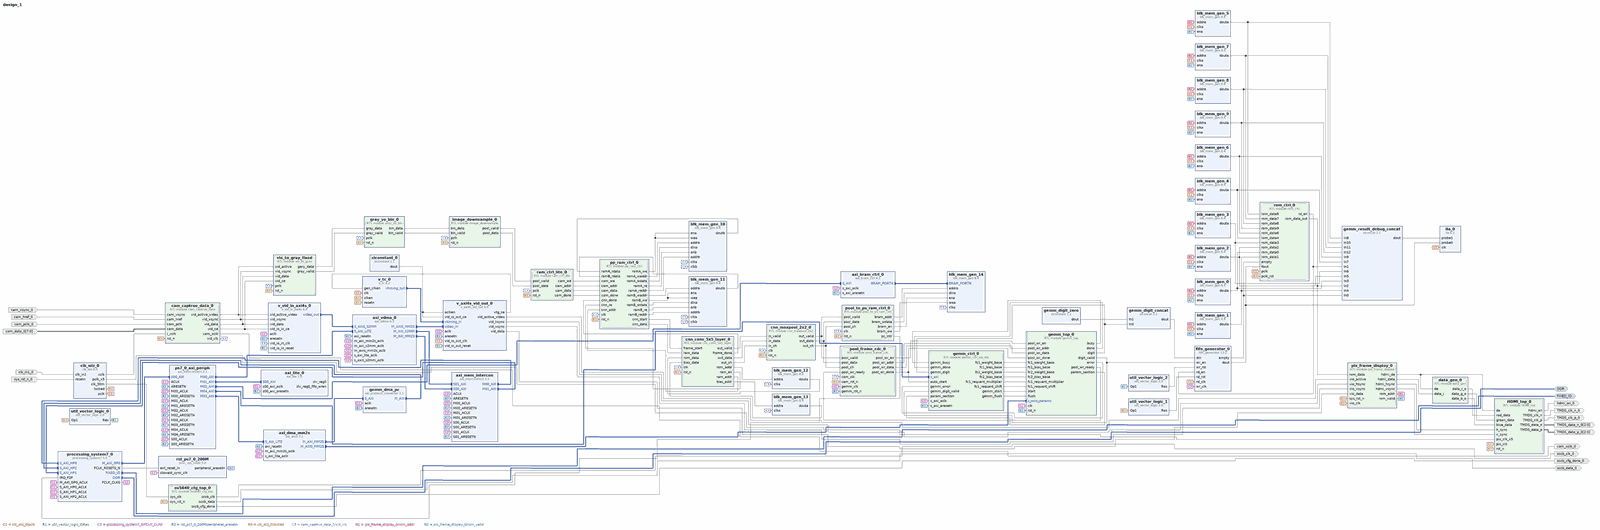
[diagram p0: block diagram of the top level, whole]
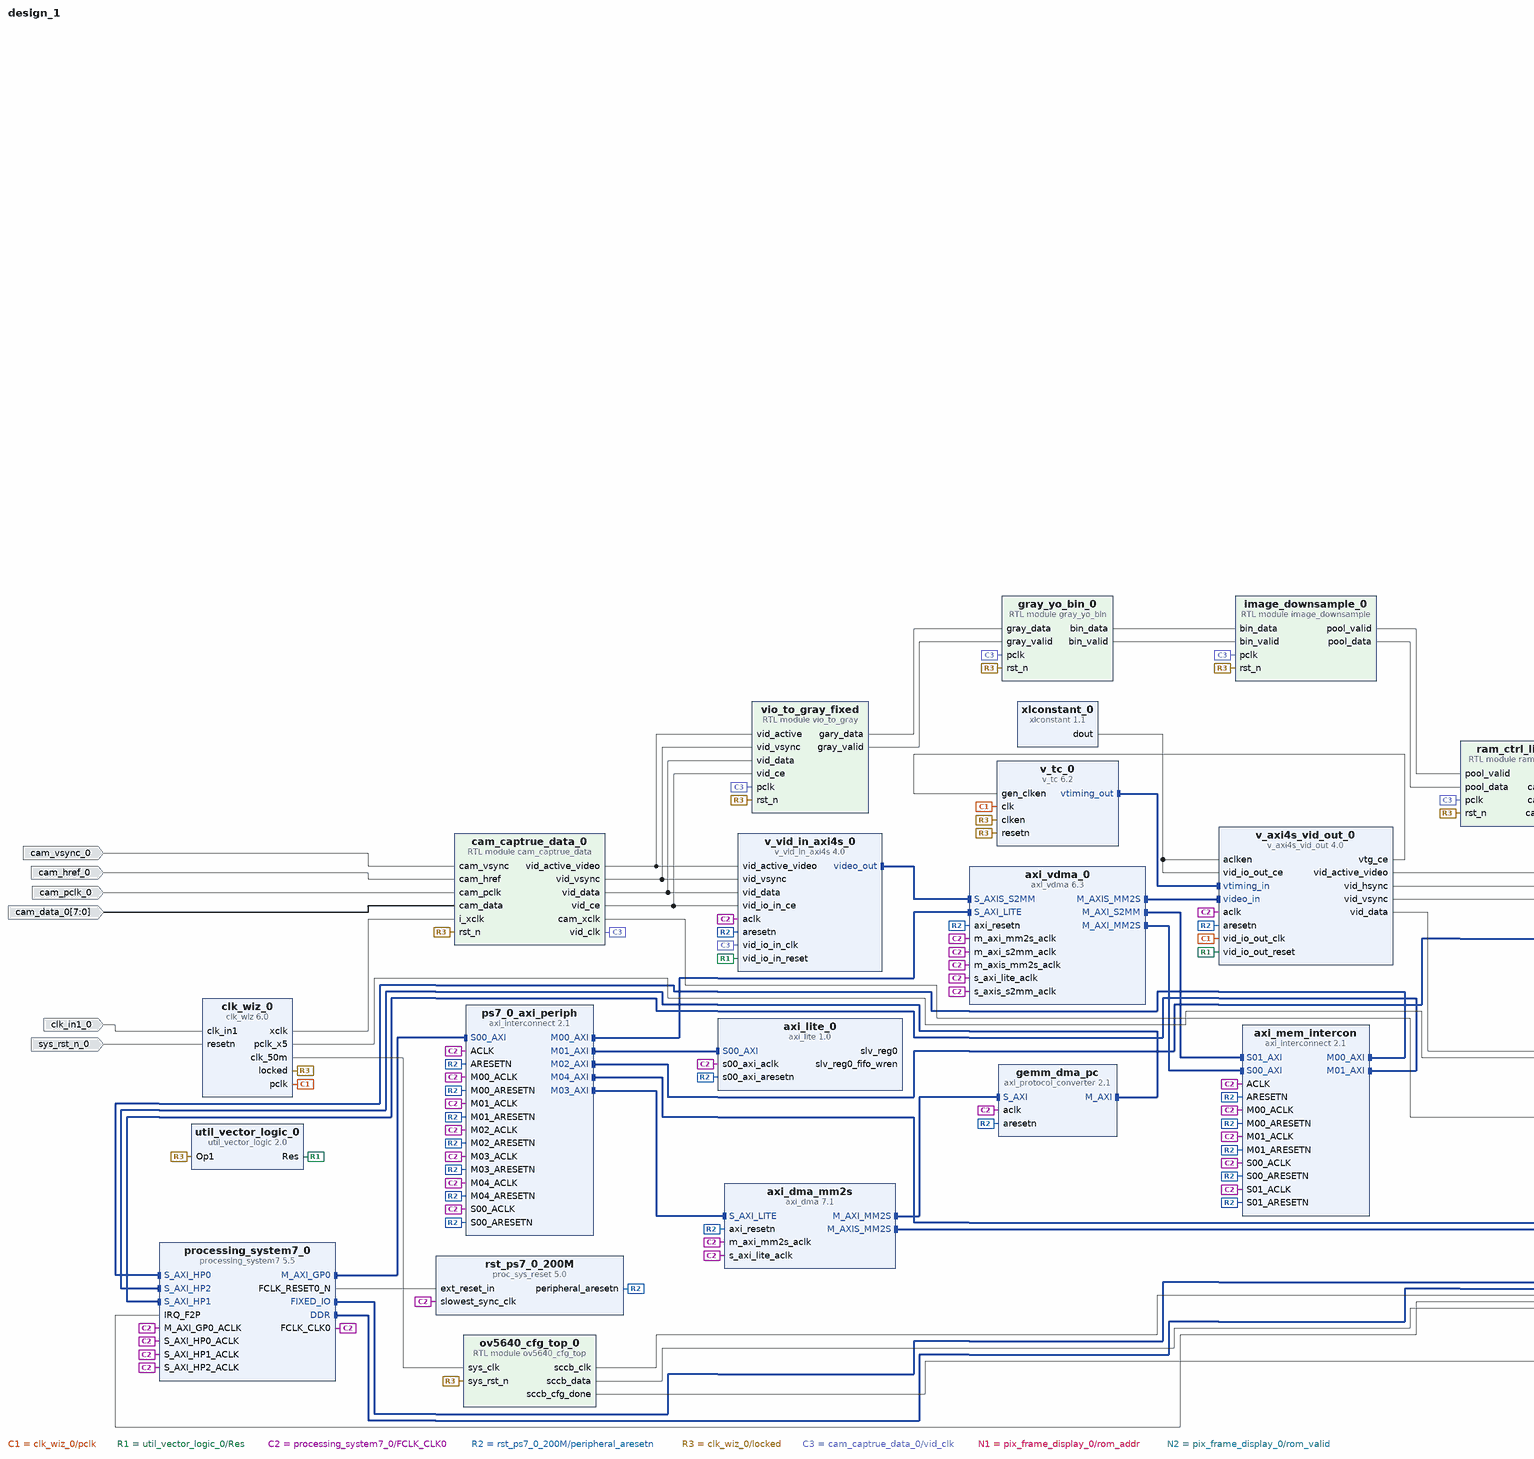
[diagram p1: block diagram of the top level, left part]
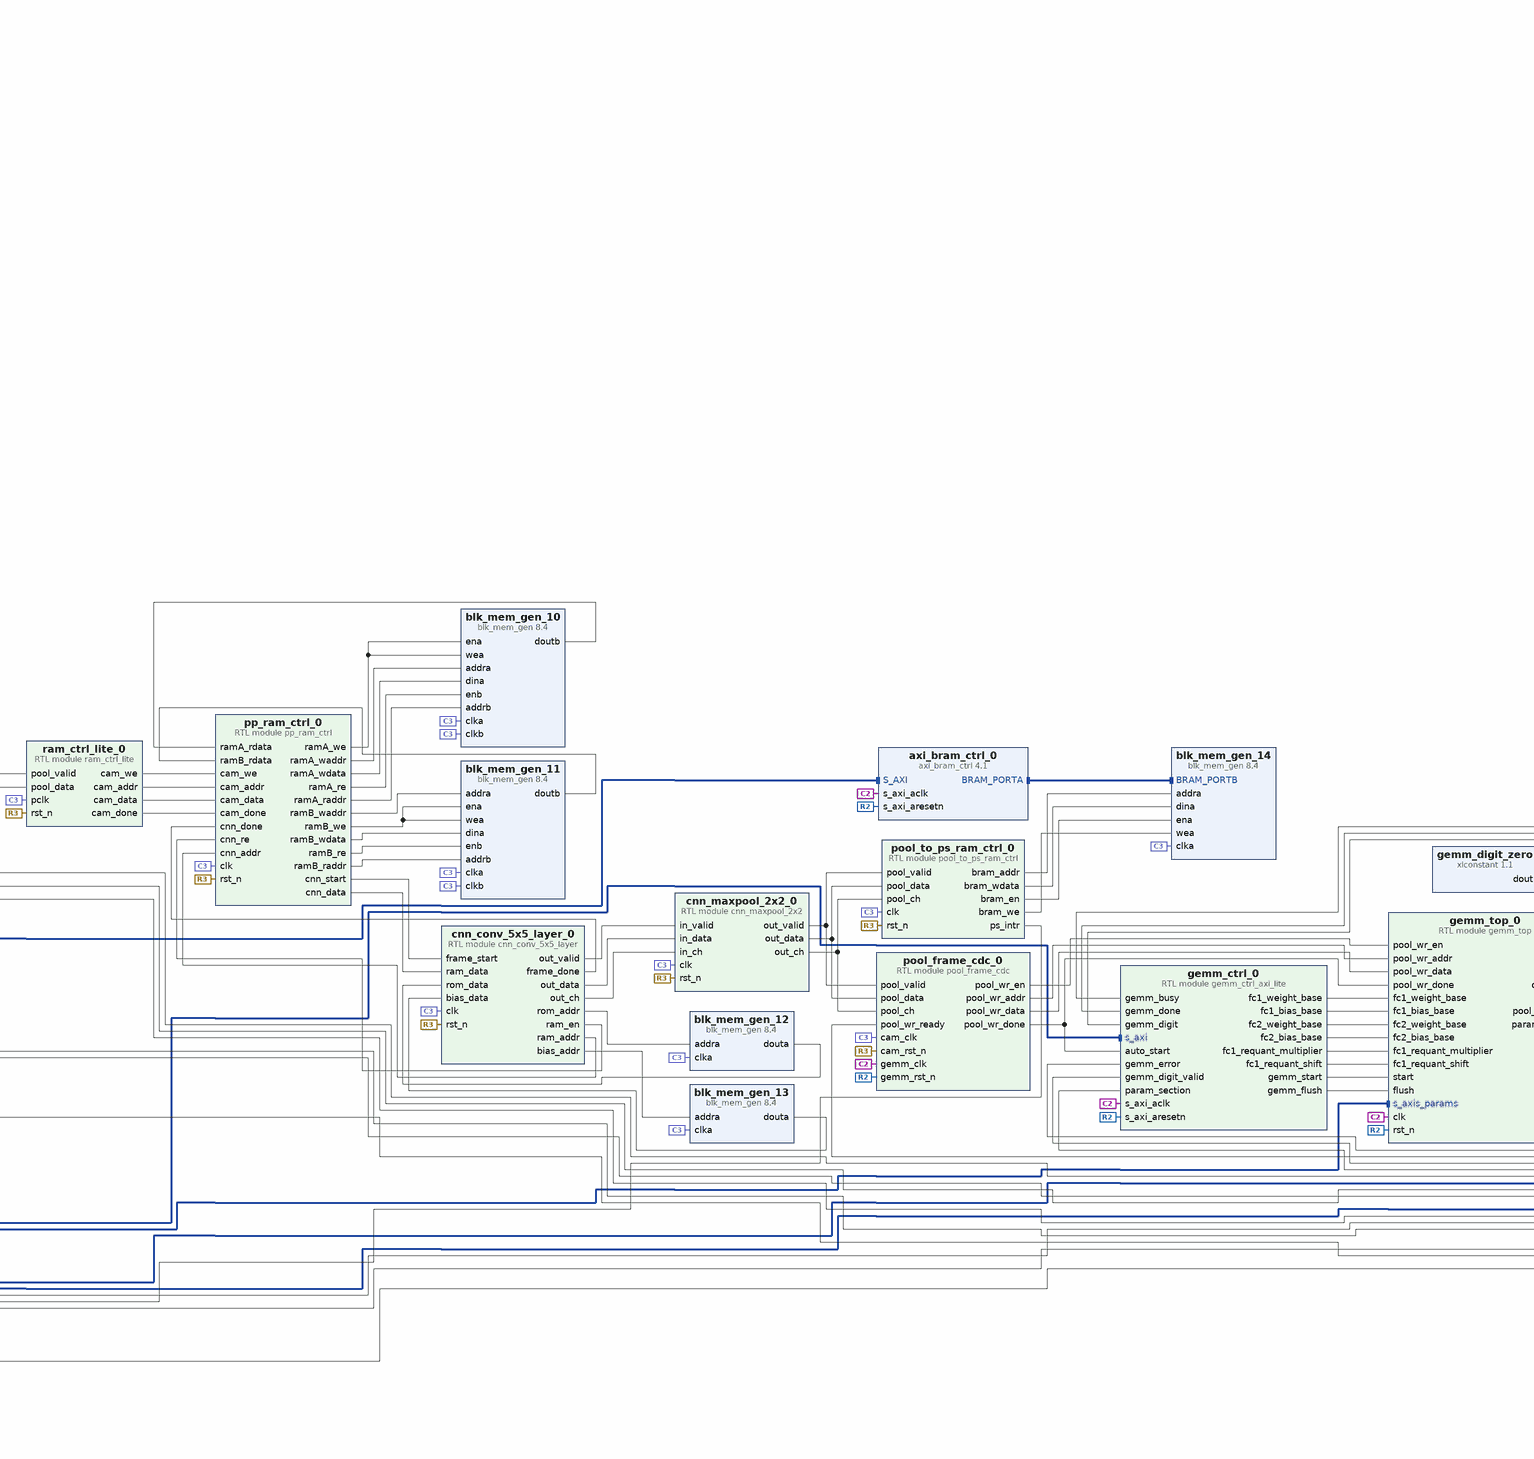
[diagram p2: block diagram of the top level, centre part]
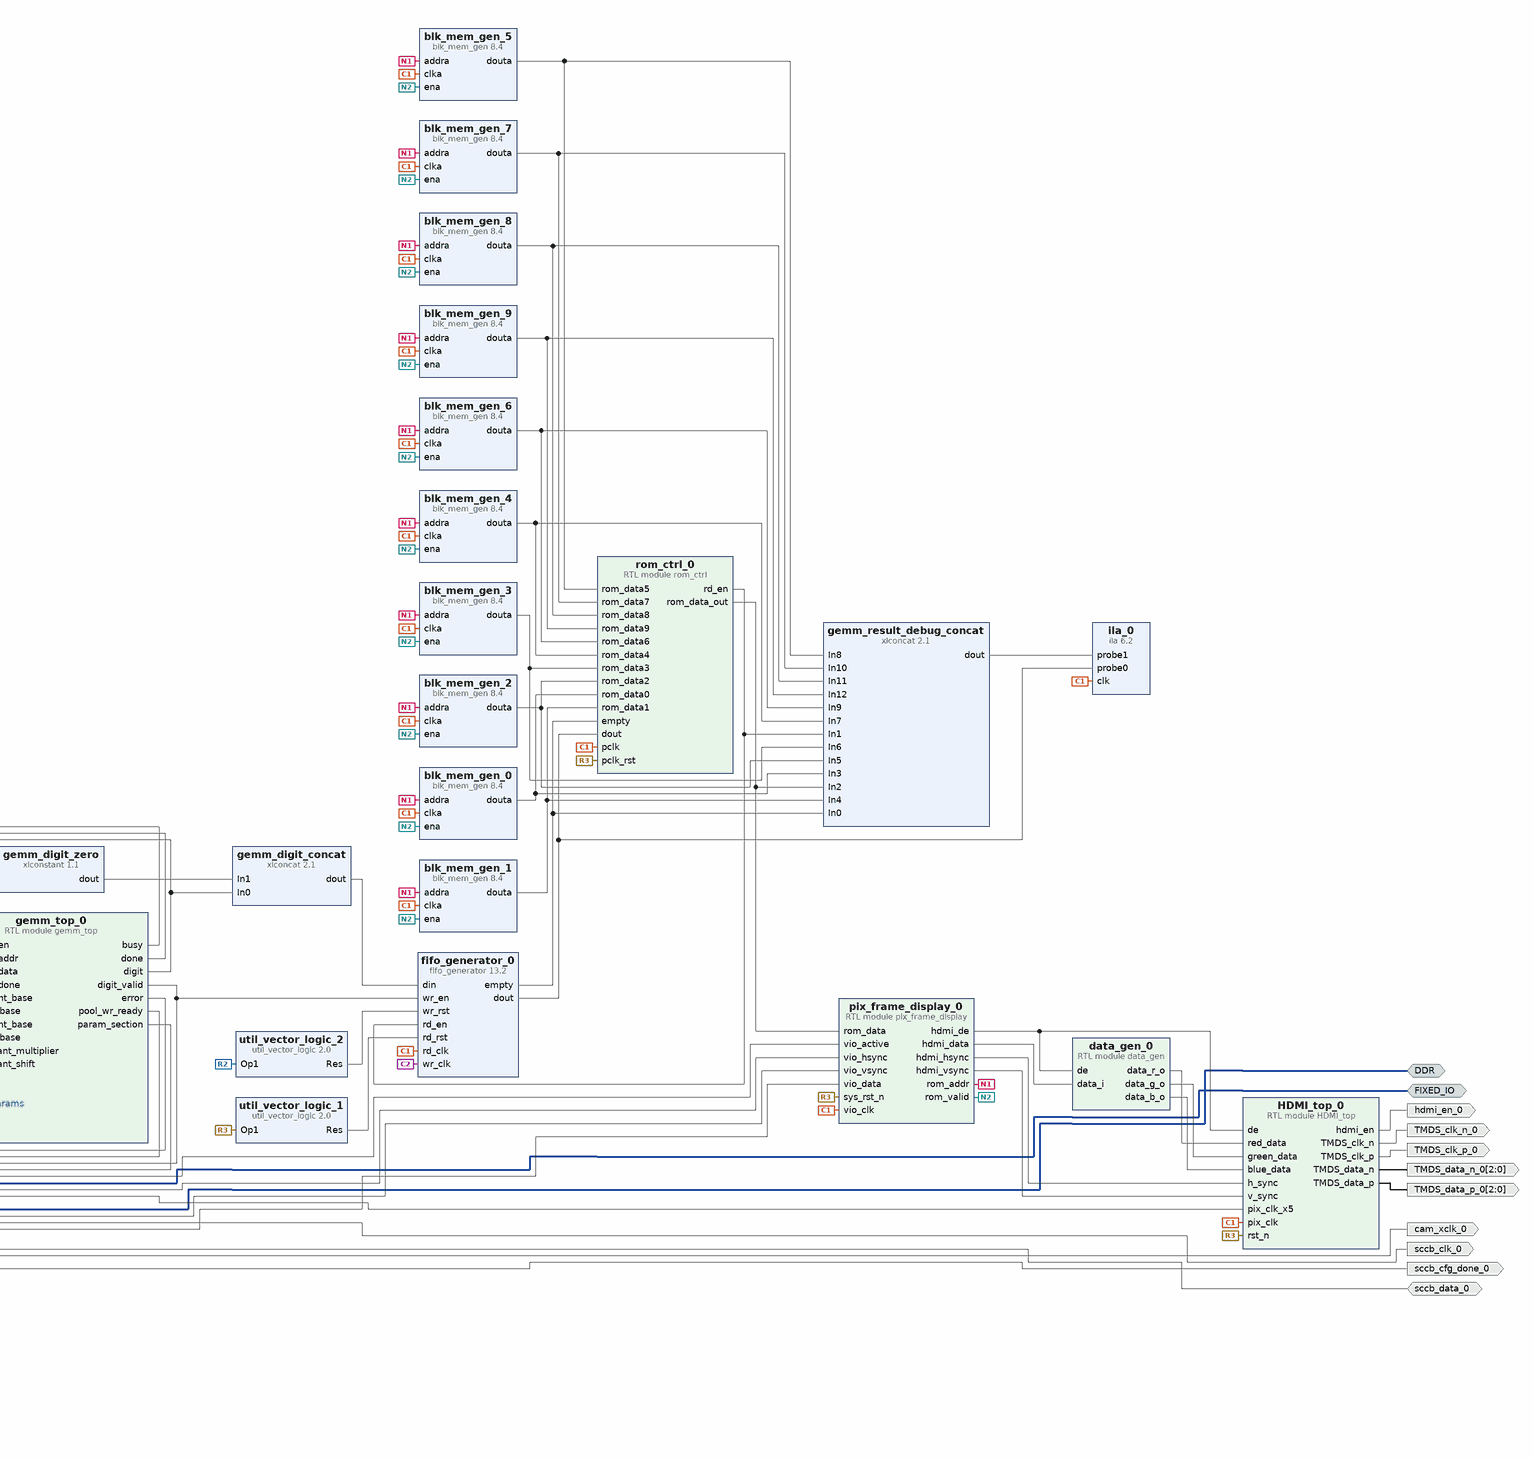
[diagram p3: block diagram of the top level, right part]
# Vivado block design design_1, xc7z010clg400-1, Vivado 2020.2
create_bd_design design_1

create_bd_intf_port -mode Master -vlnv xilinx.com:interface:ddrx_rtl:1.0 DDR
create_bd_intf_port -mode Master -vlnv xilinx.com:display_processing_system7:fixedio_rtl:1.0 FIXED_IO
create_bd_port -dir O -type clk TMDS_clk_n_0
create_bd_port -dir O -from 2 -to 0 TMDS_data_p_0
create_bd_port -dir O -type clk TMDS_clk_p_0
create_bd_port -dir O -from 2 -to 0 TMDS_data_n_0
create_bd_port -dir I -type clk clk_in1_0
set_property -dict {CONFIG.FREQ_HZ 50000000} [get_bd_ports clk_in1_0]
create_bd_port -dir O hdmi_en_0
create_bd_port -dir I -type rst sys_rst_n_0
create_bd_port -dir O -type clk sccb_clk_0
create_bd_port -dir IO sccb_data_0
create_bd_port -dir O cam_xclk_0
create_bd_port -dir I cam_vsync_0
create_bd_port -dir I cam_href_0
create_bd_port -dir I cam_pclk_0
create_bd_port -dir I -from 7 -to 0 cam_data_0
create_bd_port -dir O sccb_cfg_done_0

create_bd_cell -type module -reference HDMI_top HDMI_top_0
create_bd_cell -type ip -vlnv xilinx.com:ip:clk_wiz:6.0 clk_wiz_0
set_property -dict [list \
  CONFIG.CLKIN1_JITTER_PS 200.0 \
  CONFIG.CLKOUT1_DRIVES BUFG \
  CONFIG.CLKOUT1_JITTER 181.247 \
  CONFIG.CLKOUT1_PHASE_ERROR 150.621 \
  CONFIG.CLKOUT1_REQUESTED_OUT_FREQ 25 \
  CONFIG.CLKOUT2_DRIVES BUFG \
  CONFIG.CLKOUT2_JITTER 129.582 \
  CONFIG.CLKOUT2_PHASE_ERROR 150.621 \
  CONFIG.CLKOUT2_REQUESTED_OUT_FREQ 125 \
  CONFIG.CLKOUT2_USED true \
  CONFIG.CLKOUT3_DRIVES BUFG \
  CONFIG.CLKOUT3_JITTER 183.185 \
  CONFIG.CLKOUT3_PHASE_ERROR 150.621 \
  CONFIG.CLKOUT3_REQUESTED_OUT_FREQ 24 \
  CONFIG.CLKOUT3_USED true \
  CONFIG.CLKOUT4_DRIVES BUFG \
  CONFIG.CLKOUT4_JITTER 152.947 \
  CONFIG.CLKOUT4_PHASE_ERROR 150.621 \
  CONFIG.CLKOUT4_REQUESTED_OUT_FREQ 50 \
  CONFIG.CLKOUT4_USED true \
  CONFIG.CLKOUT5_DRIVES BUFG \
  CONFIG.CLKOUT6_DRIVES BUFG \
  CONFIG.CLKOUT7_DRIVES BUFG \
  CONFIG.CLK_OUT1_PORT pclk \
  CONFIG.CLK_OUT2_PORT pclk_x5 \
  CONFIG.CLK_OUT3_PORT xclk \
  CONFIG.CLK_OUT4_PORT clk_50m \
  CONFIG.FEEDBACK_SOURCE FDBK_AUTO \
  CONFIG.MMCM_BANDWIDTH OPTIMIZED \
  CONFIG.MMCM_CLKFBOUT_MULT_F 25 \
  CONFIG.MMCM_CLKIN1_PERIOD 20.000 \
  CONFIG.MMCM_CLKIN2_PERIOD 10.0 \
  CONFIG.MMCM_CLKOUT0_DIVIDE_F 50 \
  CONFIG.MMCM_CLKOUT1_DIVIDE 10 \
  CONFIG.MMCM_CLKOUT2_DIVIDE 52 \
  CONFIG.MMCM_CLKOUT3_DIVIDE 25 \
  CONFIG.MMCM_COMPENSATION ZHOLD \
  CONFIG.MMCM_DIVCLK_DIVIDE 1 \
  CONFIG.NUM_OUT_CLKS 4 \
  CONFIG.PRIMITIVE PLL \
  CONFIG.PRIM_IN_FREQ 50 \
  CONFIG.RESET_PORT resetn \
  CONFIG.RESET_TYPE ACTIVE_LOW \
  CONFIG.USE_RESET true \
] [get_bd_cells clk_wiz_0]
create_bd_cell -type ip -vlnv xilinx.com:ip:v_tc:6.2 v_tc_0
set_property -dict {CONFIG.HAS_AXI4_LITE false CONFIG.VIDEO_MODE 480p CONFIG.enable_detection false} [get_bd_cells v_tc_0]
create_bd_cell -type ip -vlnv xilinx.com:ip:v_axi4s_vid_out:4.0 v_axi4s_vid_out_0
set_property -dict {CONFIG.C_ADDR_WIDTH 13 CONFIG.C_HAS_ASYNC_CLK 1} [get_bd_cells v_axi4s_vid_out_0]
create_bd_cell -type ip -vlnv xilinx.com:ip:util_vector_logic:2.0 util_vector_logic_0
set_property -dict {CONFIG.C_OPERATION not CONFIG.C_SIZE 1} [get_bd_cells util_vector_logic_0]
create_bd_cell -type ip -vlnv xilinx.com:ip:axi_vdma:6.3 axi_vdma_0
set_property -dict [list \
  CONFIG.c_include_mm2s 1 \
  CONFIG.c_include_s2mm 1 \
  CONFIG.c_m_axis_mm2s_tdata_width 24 \
  CONFIG.c_mm2s_genlock_mode 3 \
  CONFIG.c_mm2s_linebuffer_depth 1024 \
  CONFIG.c_num_fstores 3 \
  CONFIG.c_s2mm_genlock_mode 2 \
  CONFIG.c_s2mm_linebuffer_depth 1024 \
] [get_bd_cells axi_vdma_0]
create_bd_cell -type ip -vlnv xilinx.com:ip:processing_system7:5.5 processing_system7_0
set_property -dict [list \
  CONFIG.PCW_FPGA0_PERIPHERAL_FREQMHZ 100 \
  CONFIG.PCW_IRQ_F2P_INTR 1 \
  CONFIG.PCW_PRESET_BANK1_VOLTAGE {LVCMOS 1.8V} \
  CONFIG.PCW_UART1_PERIPHERAL_ENABLE 1 \
  CONFIG.PCW_UART1_UART1_IO {MIO 48 .. 49} \
  CONFIG.PCW_UART_PERIPHERAL_FREQMHZ 100 \
  CONFIG.PCW_UIPARAM_DDR_BUS_WIDTH {16 Bit} \
  CONFIG.PCW_UIPARAM_DDR_PARTNO {MT41J256M16 RE-125} \
  CONFIG.PCW_USE_FABRIC_INTERRUPT 1 \
  CONFIG.PCW_USE_S_AXI_HP0 1 \
  CONFIG.PCW_USE_S_AXI_HP1 1 \
  CONFIG.PCW_USE_S_AXI_HP2 1 \
] [get_bd_cells processing_system7_0]
# 42 more settings of processing_system7_0 are not shown: defaults, MIO pin electricals, DDR timing, and values the tool derives
create_bd_cell -type ip -vlnv xilinx.com:ip:axi_interconnect:2.1 ps7_0_axi_periph
set_property -dict {CONFIG.NUM_MI 5} [get_bd_cells ps7_0_axi_periph]
create_bd_cell -type ip -vlnv xilinx.com:ip:proc_sys_reset:5.0 rst_ps7_0_200M
create_bd_cell -type ip -vlnv xilinx.com:ip:axi_interconnect:2.1 axi_mem_intercon
set_property -dict {CONFIG.NUM_MI 2 CONFIG.NUM_SI 2} [get_bd_cells axi_mem_intercon]
create_bd_cell -type ip -vlnv xilinx.com:ip:xlconstant:1.1 xlconstant_0
create_bd_cell -type ip -vlnv xilinx.com:ip:v_vid_in_axi4s:4.0 v_vid_in_axi4s_0
set_property -dict {CONFIG.C_ADDR_WIDTH 13 CONFIG.C_HAS_ASYNC_CLK 1} [get_bd_cells v_vid_in_axi4s_0]
create_bd_cell -type module -reference cam_captrue_data cam_captrue_data_0
create_bd_cell -type module -reference data_gen data_gen_0
create_bd_cell -type ip -vlnv xilinx.com:ip:blk_mem_gen:8.4 blk_mem_gen_0
set_property -dict [list \
  CONFIG.Coe_File ../../../../../../../../8_num_coe/zero.coe \
  CONFIG.Enable_32bit_Address false \
  CONFIG.Load_Init_File true \
  CONFIG.Memory_Type Single_Port_ROM \
  CONFIG.Port_A_Write_Rate 0 \
  CONFIG.Register_PortA_Output_of_Memory_Primitives false \
  CONFIG.Use_RSTA_Pin false \
  CONFIG.Write_Depth_A 10000 \
  CONFIG.Write_Width_A 1 \
  CONFIG.use_bram_block Stand_Alone \
] [get_bd_cells blk_mem_gen_0]
create_bd_cell -type ip -vlnv xilinx.com:ip:blk_mem_gen:8.4 blk_mem_gen_1
set_property -dict [list \
  CONFIG.Coe_File ../../../../../../../../8_num_coe/one.coe \
  CONFIG.Enable_32bit_Address false \
  CONFIG.Load_Init_File true \
  CONFIG.Memory_Type Single_Port_ROM \
  CONFIG.Port_A_Write_Rate 0 \
  CONFIG.Register_PortA_Output_of_Memory_Primitives false \
  CONFIG.Use_RSTA_Pin false \
  CONFIG.Write_Depth_A 10000 \
  CONFIG.Write_Width_A 1 \
  CONFIG.use_bram_block Stand_Alone \
] [get_bd_cells blk_mem_gen_1]
create_bd_cell -type ip -vlnv xilinx.com:ip:blk_mem_gen:8.4 blk_mem_gen_2
set_property -dict [list \
  CONFIG.Coe_File ../../../../../../../../8_num_coe/two.coe \
  CONFIG.Enable_32bit_Address false \
  CONFIG.Load_Init_File true \
  CONFIG.Memory_Type Single_Port_ROM \
  CONFIG.Port_A_Write_Rate 0 \
  CONFIG.Register_PortA_Output_of_Memory_Primitives false \
  CONFIG.Use_RSTA_Pin false \
  CONFIG.Write_Depth_A 10000 \
  CONFIG.Write_Width_A 1 \
  CONFIG.use_bram_block Stand_Alone \
] [get_bd_cells blk_mem_gen_2]
create_bd_cell -type ip -vlnv xilinx.com:ip:blk_mem_gen:8.4 blk_mem_gen_3
set_property -dict [list \
  CONFIG.Coe_File ../../../../../../../../8_num_coe/three.coe \
  CONFIG.Enable_32bit_Address false \
  CONFIG.Load_Init_File true \
  CONFIG.Memory_Type Single_Port_ROM \
  CONFIG.Port_A_Write_Rate 0 \
  CONFIG.Register_PortA_Output_of_Memory_Primitives false \
  CONFIG.Use_RSTA_Pin false \
  CONFIG.Write_Depth_A 10000 \
  CONFIG.Write_Width_A 1 \
  CONFIG.use_bram_block Stand_Alone \
] [get_bd_cells blk_mem_gen_3]
create_bd_cell -type ip -vlnv xilinx.com:ip:blk_mem_gen:8.4 blk_mem_gen_4
set_property -dict [list \
  CONFIG.Coe_File ../../../../../../../../8_num_coe/four.coe \
  CONFIG.Enable_32bit_Address false \
  CONFIG.Load_Init_File true \
  CONFIG.Memory_Type Single_Port_ROM \
  CONFIG.Port_A_Write_Rate 0 \
  CONFIG.Register_PortA_Output_of_Memory_Primitives false \
  CONFIG.Use_RSTA_Pin false \
  CONFIG.Write_Depth_A 10000 \
  CONFIG.Write_Width_A 1 \
  CONFIG.use_bram_block Stand_Alone \
] [get_bd_cells blk_mem_gen_4]
create_bd_cell -type ip -vlnv xilinx.com:ip:blk_mem_gen:8.4 blk_mem_gen_5
set_property -dict [list \
  CONFIG.Coe_File ../../../../../../../../8_num_coe/five.coe \
  CONFIG.Enable_32bit_Address false \
  CONFIG.Load_Init_File true \
  CONFIG.Memory_Type Single_Port_ROM \
  CONFIG.Port_A_Write_Rate 0 \
  CONFIG.Register_PortA_Output_of_Memory_Primitives false \
  CONFIG.Use_RSTA_Pin false \
  CONFIG.Write_Depth_A 10000 \
  CONFIG.Write_Width_A 1 \
  CONFIG.use_bram_block Stand_Alone \
] [get_bd_cells blk_mem_gen_5]
create_bd_cell -type ip -vlnv xilinx.com:ip:blk_mem_gen:8.4 blk_mem_gen_6
set_property -dict [list \
  CONFIG.Coe_File ../../../../../../../../8_num_coe/six.coe \
  CONFIG.Enable_32bit_Address false \
  CONFIG.Load_Init_File true \
  CONFIG.Memory_Type Single_Port_ROM \
  CONFIG.Port_A_Write_Rate 0 \
  CONFIG.Register_PortA_Output_of_Memory_Primitives false \
  CONFIG.Use_RSTA_Pin false \
  CONFIG.Write_Depth_A 10000 \
  CONFIG.Write_Width_A 1 \
  CONFIG.use_bram_block Stand_Alone \
] [get_bd_cells blk_mem_gen_6]
create_bd_cell -type ip -vlnv xilinx.com:ip:blk_mem_gen:8.4 blk_mem_gen_7
set_property -dict [list \
  CONFIG.Coe_File ../../../../../../../../8_num_coe/seven.coe \
  CONFIG.Enable_32bit_Address false \
  CONFIG.Load_Init_File true \
  CONFIG.Memory_Type Single_Port_ROM \
  CONFIG.Port_A_Write_Rate 0 \
  CONFIG.Register_PortA_Output_of_Memory_Primitives false \
  CONFIG.Use_RSTA_Pin false \
  CONFIG.Write_Depth_A 10000 \
  CONFIG.Write_Width_A 1 \
  CONFIG.use_bram_block Stand_Alone \
] [get_bd_cells blk_mem_gen_7]
create_bd_cell -type ip -vlnv xilinx.com:ip:blk_mem_gen:8.4 blk_mem_gen_8
set_property -dict [list \
  CONFIG.Coe_File ../../../../../../../../8_num_coe/eight.coe \
  CONFIG.Enable_32bit_Address false \
  CONFIG.Load_Init_File true \
  CONFIG.Memory_Type Single_Port_ROM \
  CONFIG.Port_A_Write_Rate 0 \
  CONFIG.Register_PortA_Output_of_Memory_Primitives false \
  CONFIG.Use_RSTA_Pin false \
  CONFIG.Write_Depth_A 10000 \
  CONFIG.Write_Width_A 1 \
  CONFIG.use_bram_block Stand_Alone \
] [get_bd_cells blk_mem_gen_8]
create_bd_cell -type ip -vlnv xilinx.com:ip:blk_mem_gen:8.4 blk_mem_gen_9
set_property -dict [list \
  CONFIG.Coe_File ../../../../../../../../8_num_coe/nine.coe \
  CONFIG.Enable_32bit_Address false \
  CONFIG.Load_Init_File true \
  CONFIG.Memory_Type Single_Port_ROM \
  CONFIG.Port_A_Write_Rate 0 \
  CONFIG.Register_PortA_Output_of_Memory_Primitives false \
  CONFIG.Use_RSTA_Pin false \
  CONFIG.Write_Depth_A 10000 \
  CONFIG.Write_Width_A 1 \
  CONFIG.use_bram_block Stand_Alone \
] [get_bd_cells blk_mem_gen_9]
create_bd_cell -type ip -vlnv xilinx.com:ip:fifo_generator:13.2 fifo_generator_0
set_property -dict [list \
  CONFIG.Enable_Reset_Synchronization false \
  CONFIG.Fifo_Implementation Independent_Clocks_Block_RAM \
  CONFIG.Full_Flags_Reset_Value 1 \
  CONFIG.Input_Data_Width 32 \
  CONFIG.Input_Depth 256 \
  CONFIG.Output_Data_Width 32 \
  CONFIG.Performance_Options First_Word_Fall_Through \
] [get_bd_cells fifo_generator_0]
create_bd_cell -type ip -vlnv xilinx.com:ip:util_vector_logic:2.0 util_vector_logic_1
set_property -dict {CONFIG.C_OPERATION not CONFIG.C_SIZE 1} [get_bd_cells util_vector_logic_1]
create_bd_cell -type ip -vlnv xilinx.com:ip:util_vector_logic:2.0 util_vector_logic_2
set_property -dict {CONFIG.C_OPERATION not CONFIG.C_SIZE 1} [get_bd_cells util_vector_logic_2]
create_bd_cell -type module -reference rom_ctrl rom_ctrl_0
create_bd_cell -type ip -vlnv xilinx.com:ip:ila:6.2 ila_0
set_property -dict [list \
  CONFIG.C_DATA_DEPTH 1024 \
  CONFIG.C_ENABLE_ILA_AXI_MON false \
  CONFIG.C_EN_STRG_QUAL 1 \
  CONFIG.C_MONITOR_TYPE Native \
  CONFIG.C_NUM_OF_PROBES 2 \
  CONFIG.C_PROBE0_WIDTH 32 \
  CONFIG.C_PROBE1_WIDTH 13 \
  CONFIG.C_PROBE2_WIDTH 1 \
  CONFIG.C_PROBE3_WIDTH 1 \
] [get_bd_cells ila_0]
create_bd_cell -type ip -vlnv xilinx.com:user:axi_lite:1.0 axi_lite_0
create_bd_cell -type module -reference ov5640_cfg_top ov5640_cfg_top_0
create_bd_cell -type module -reference pix_frame_display pix_frame_display_0
create_bd_cell -type ip -vlnv xilinx.com:ip:blk_mem_gen:8.4 blk_mem_gen_10
set_property -dict [list \
  CONFIG.Enable_32bit_Address false \
  CONFIG.Enable_B Use_ENB_Pin \
  CONFIG.Memory_Type Simple_Dual_Port_RAM \
  CONFIG.Operating_Mode_A NO_CHANGE \
  CONFIG.Port_B_Clock 100 \
  CONFIG.Port_B_Enable_Rate 100 \
  CONFIG.Read_Width_B 1 \
  CONFIG.Register_PortB_Output_of_Memory_Primitives false \
  CONFIG.Use_Byte_Write_Enable false \
  CONFIG.Write_Depth_A 1024 \
  CONFIG.Write_Width_A 1 \
  CONFIG.Write_Width_B 1 \
  CONFIG.use_bram_block Stand_Alone \
] [get_bd_cells blk_mem_gen_10]
create_bd_cell -type ip -vlnv xilinx.com:ip:blk_mem_gen:8.4 blk_mem_gen_11
set_property -dict [list \
  CONFIG.Enable_32bit_Address false \
  CONFIG.Enable_B Use_ENB_Pin \
  CONFIG.Memory_Type Simple_Dual_Port_RAM \
  CONFIG.Operating_Mode_A NO_CHANGE \
  CONFIG.Port_B_Clock 100 \
  CONFIG.Port_B_Enable_Rate 100 \
  CONFIG.Read_Width_B 1 \
  CONFIG.Register_PortB_Output_of_Memory_Primitives false \
  CONFIG.Use_Byte_Write_Enable false \
  CONFIG.Write_Depth_A 1024 \
  CONFIG.Write_Width_A 1 \
  CONFIG.Write_Width_B 1 \
  CONFIG.use_bram_block Stand_Alone \
] [get_bd_cells blk_mem_gen_11]
create_bd_cell -type ip -vlnv xilinx.com:ip:blk_mem_gen:8.4 blk_mem_gen_12
set_property -dict [list \
  CONFIG.Coe_File ../../../../../../../../11_python/conv_weight_200b.coe \
  CONFIG.Enable_32bit_Address false \
  CONFIG.Enable_A Always_Enabled \
  CONFIG.Load_Init_File true \
  CONFIG.Memory_Type Single_Port_ROM \
  CONFIG.Port_A_Write_Rate 0 \
  CONFIG.Register_PortA_Output_of_Memory_Primitives false \
  CONFIG.Use_RSTA_Pin false \
  CONFIG.Write_Depth_A 32 \
  CONFIG.Write_Width_A 200 \
  CONFIG.use_bram_block Stand_Alone \
] [get_bd_cells blk_mem_gen_12]
create_bd_cell -type ip -vlnv xilinx.com:ip:blk_mem_gen:8.4 blk_mem_gen_13
set_property -dict [list \
  CONFIG.Coe_File ../../../../../../../../11_python/conv_bias_16b.coe \
  CONFIG.Enable_32bit_Address false \
  CONFIG.Enable_A Always_Enabled \
  CONFIG.Load_Init_File true \
  CONFIG.Memory_Type Single_Port_ROM \
  CONFIG.Port_A_Write_Rate 0 \
  CONFIG.Register_PortA_Output_of_Memory_Primitives false \
  CONFIG.Use_RSTA_Pin false \
  CONFIG.Write_Depth_A 32 \
  CONFIG.Write_Width_A 16 \
  CONFIG.use_bram_block Stand_Alone \
] [get_bd_cells blk_mem_gen_13]
create_bd_cell -type ip -vlnv xilinx.com:ip:blk_mem_gen:8.4 blk_mem_gen_14
set_property -dict [list \
  CONFIG.EN_SAFETY_CKT true \
  CONFIG.Enable_32bit_Address true \
  CONFIG.Enable_B Use_ENB_Pin \
  CONFIG.Memory_Type True_Dual_Port_RAM \
  CONFIG.Port_B_Clock 100 \
  CONFIG.Port_B_Enable_Rate 100 \
  CONFIG.Port_B_Write_Rate 50 \
  CONFIG.Register_PortA_Output_of_Memory_Primitives false \
  CONFIG.Register_PortB_Output_of_Memory_Primitives false \
  CONFIG.Use_RSTA_Pin true \
  CONFIG.Use_RSTB_Pin true \
  CONFIG.use_bram_block BRAM_Controller \
] [get_bd_cells blk_mem_gen_14]
create_bd_cell -type ip -vlnv xilinx.com:ip:axi_bram_ctrl:4.1 axi_bram_ctrl_0
set_property -dict {CONFIG.SINGLE_PORT_BRAM 1} [get_bd_cells axi_bram_ctrl_0]
create_bd_cell -type module -reference ram_ctrl_lite ram_ctrl_lite_0
create_bd_cell -type module -reference cnn_maxpool_2x2 cnn_maxpool_2x2_0
create_bd_cell -type module -reference pool_to_ps_ram_ctrl pool_to_ps_ram_ctrl_0
create_bd_cell -type module -reference pool_frame_cdc pool_frame_cdc_0
create_bd_cell -type module -reference gemm_ctrl_axi_lite gemm_ctrl_0
create_bd_cell -type ip -vlnv xilinx.com:ip:axi_dma:7.1 axi_dma_mm2s
set_property -dict [list \
  CONFIG.c_include_s2mm 0 \
  CONFIG.c_include_sg 0 \
  CONFIG.c_m_axi_mm2s_data_width 64 \
  CONFIG.c_m_axis_mm2s_tdata_width 64 \
  CONFIG.c_mm2s_burst_size 16 \
  CONFIG.c_sg_length_width 23 \
] [get_bd_cells axi_dma_mm2s]
create_bd_cell -type ip -vlnv xilinx.com:ip:axi_protocol_converter:2.1 gemm_dma_pc
create_bd_cell -type ip -vlnv xilinx.com:ip:xlconstant:1.1 gemm_digit_zero
set_property -dict {CONFIG.CONST_VAL 0 CONFIG.CONST_WIDTH 28} [get_bd_cells gemm_digit_zero]
create_bd_cell -type ip -vlnv xilinx.com:ip:xlconcat:2.1 gemm_digit_concat
set_property -dict {CONFIG.IN0_WIDTH 4 CONFIG.IN1_WIDTH 28 CONFIG.NUM_PORTS 2} [get_bd_cells gemm_digit_concat]
create_bd_cell -type ip -vlnv xilinx.com:ip:xlconcat:2.1 gemm_result_debug_concat
set_property -dict [list \
  CONFIG.IN0_WIDTH 1 \
  CONFIG.IN10_WIDTH 1 \
  CONFIG.IN11_WIDTH 1 \
  CONFIG.IN12_WIDTH 1 \
  CONFIG.IN1_WIDTH 1 \
  CONFIG.IN2_WIDTH 1 \
  CONFIG.IN3_WIDTH 1 \
  CONFIG.IN4_WIDTH 1 \
  CONFIG.IN5_WIDTH 1 \
  CONFIG.IN6_WIDTH 1 \
  CONFIG.IN7_WIDTH 1 \
  CONFIG.IN8_WIDTH 1 \
  CONFIG.IN9_WIDTH 1 \
  CONFIG.NUM_PORTS 13 \
] [get_bd_cells gemm_result_debug_concat]
create_bd_cell -type module -reference vio_to_gray vio_to_gray_fixed
create_bd_cell -type module -reference pp_ram_ctrl pp_ram_ctrl_0
create_bd_cell -type module -reference cnn_conv_5x5_layer cnn_conv_5x5_layer_0
create_bd_cell -type module -reference gemm_top gemm_top_0
create_bd_cell -type module -reference gray_yo_bin gray_yo_bin_0
set_property -dict {CONFIG.THRESHOLD {"01011010"}} [get_bd_cells gray_yo_bin_0]
create_bd_cell -type module -reference image_downsample image_downsample_0

# ---- connections ----

connect_bd_intf_net [get_bd_intf_pins v_tc_0/vtiming_out] [get_bd_intf_pins v_axi4s_vid_out_0/vtiming_in]
connect_bd_intf_net [get_bd_intf_ports FIXED_IO] [get_bd_intf_pins processing_system7_0/FIXED_IO]
connect_bd_intf_net [get_bd_intf_pins axi_vdma_0/S_AXIS_S2MM] [get_bd_intf_pins v_vid_in_axi4s_0/video_out]
connect_bd_intf_net [get_bd_intf_pins ps7_0_axi_periph/M02_AXI] [get_bd_intf_pins axi_bram_ctrl_0/S_AXI]
connect_bd_intf_net [get_bd_intf_pins ps7_0_axi_periph/M04_AXI] [get_bd_intf_pins gemm_ctrl_0/s_axi]
connect_bd_intf_net [get_bd_intf_pins ps7_0_axi_periph/M00_AXI] [get_bd_intf_pins axi_vdma_0/S_AXI_LITE]
connect_bd_intf_net [get_bd_intf_pins ps7_0_axi_periph/M01_AXI] [get_bd_intf_pins axi_lite_0/S00_AXI]
connect_bd_intf_net [get_bd_intf_pins axi_mem_intercon/M00_AXI] [get_bd_intf_pins processing_system7_0/S_AXI_HP0]
connect_bd_intf_net [get_bd_intf_ports DDR] [get_bd_intf_pins processing_system7_0/DDR]
connect_bd_intf_net [get_bd_intf_pins axi_bram_ctrl_0/BRAM_PORTA] [get_bd_intf_pins blk_mem_gen_14/BRAM_PORTB]
connect_bd_intf_net [get_bd_intf_pins gemm_dma_pc/M_AXI] [get_bd_intf_pins processing_system7_0/S_AXI_HP2]
connect_bd_intf_net [get_bd_intf_pins axi_vdma_0/M_AXIS_MM2S] [get_bd_intf_pins v_axi4s_vid_out_0/video_in]
connect_bd_intf_net [get_bd_intf_pins axi_vdma_0/M_AXI_S2MM] [get_bd_intf_pins axi_mem_intercon/S01_AXI]
connect_bd_intf_net [get_bd_intf_pins axi_mem_intercon/M01_AXI] [get_bd_intf_pins processing_system7_0/S_AXI_HP1]
connect_bd_intf_net [get_bd_intf_pins axi_dma_mm2s/M_AXIS_MM2S] [get_bd_intf_pins gemm_top_0/s_axis_params]
connect_bd_intf_net [get_bd_intf_pins axi_vdma_0/M_AXI_MM2S] [get_bd_intf_pins axi_mem_intercon/S00_AXI]
connect_bd_intf_net [get_bd_intf_pins ps7_0_axi_periph/M03_AXI] [get_bd_intf_pins axi_dma_mm2s/S_AXI_LITE]
connect_bd_intf_net [get_bd_intf_pins axi_dma_mm2s/M_AXI_MM2S] [get_bd_intf_pins gemm_dma_pc/S_AXI]
connect_bd_intf_net [get_bd_intf_pins processing_system7_0/M_AXI_GP0] [get_bd_intf_pins ps7_0_axi_periph/S00_AXI]
connect_bd_net [get_bd_pins clk_wiz_0/pclk_x5] [get_bd_pins HDMI_top_0/pix_clk_x5]
connect_bd_net [get_bd_pins HDMI_top_0/TMDS_clk_n] [get_bd_ports TMDS_clk_n_0]
connect_bd_net [get_bd_pins HDMI_top_0/TMDS_data_p] [get_bd_ports TMDS_data_p_0]
connect_bd_net [get_bd_pins HDMI_top_0/TMDS_clk_p] [get_bd_ports TMDS_clk_p_0]
connect_bd_net [get_bd_pins HDMI_top_0/TMDS_data_n] [get_bd_ports TMDS_data_n_0]
connect_bd_net -net clk_in1_0_1 [get_bd_ports clk_in1_0] [get_bd_pins clk_wiz_0/clk_in1]
connect_bd_net [get_bd_pins HDMI_top_0/hdmi_en] [get_bd_ports hdmi_en_0]
connect_bd_net [get_bd_pins clk_wiz_0/pclk] \
  [get_bd_pins HDMI_top_0/pix_clk] [get_bd_pins v_tc_0/clk] [get_bd_pins v_axi4s_vid_out_0/vid_io_out_clk] \
  [get_bd_pins blk_mem_gen_0/clka] [get_bd_pins blk_mem_gen_1/clka] [get_bd_pins blk_mem_gen_2/clka] \
  [get_bd_pins blk_mem_gen_4/clka] [get_bd_pins blk_mem_gen_3/clka] [get_bd_pins blk_mem_gen_6/clka] \
  [get_bd_pins blk_mem_gen_9/clka] [get_bd_pins blk_mem_gen_7/clka] [get_bd_pins blk_mem_gen_5/clka] \
  [get_bd_pins blk_mem_gen_8/clka] [get_bd_pins fifo_generator_0/rd_clk] [get_bd_pins rom_ctrl_0/pclk] \
  [get_bd_pins pix_frame_display_0/vio_clk] [get_bd_pins ila_0/clk]
connect_bd_net [get_bd_pins v_axi4s_vid_out_0/vid_active_video] [get_bd_pins pix_frame_display_0/vio_active]
connect_bd_net [get_bd_pins v_axi4s_vid_out_0/vtg_ce] [get_bd_pins v_tc_0/gen_clken]
connect_bd_net [get_bd_pins util_vector_logic_0/Res] [get_bd_pins v_axi4s_vid_out_0/vid_io_out_reset] [get_bd_pins v_vid_in_axi4s_0/vid_io_in_reset]
connect_bd_net [get_bd_pins processing_system7_0/FCLK_CLK0] \
  [get_bd_pins v_axi4s_vid_out_0/aclk] [get_bd_pins axi_vdma_0/m_axi_mm2s_aclk] [get_bd_pins axi_vdma_0/m_axis_mm2s_aclk] \
  [get_bd_pins axi_vdma_0/s_axi_lite_aclk] [get_bd_pins ps7_0_axi_periph/M00_ACLK] \
  [get_bd_pins rst_ps7_0_200M/slowest_sync_clk] [get_bd_pins processing_system7_0/M_AXI_GP0_ACLK] \
  [get_bd_pins ps7_0_axi_periph/S00_ACLK] [get_bd_pins ps7_0_axi_periph/ACLK] [get_bd_pins axi_mem_intercon/S00_ACLK] \
  [get_bd_pins processing_system7_0/S_AXI_HP0_ACLK] [get_bd_pins axi_mem_intercon/M00_ACLK] \
  [get_bd_pins axi_mem_intercon/ACLK] [get_bd_pins axi_vdma_0/m_axi_s2mm_aclk] [get_bd_pins axi_mem_intercon/S01_ACLK] \
  [get_bd_pins axi_vdma_0/s_axis_s2mm_aclk] [get_bd_pins v_vid_in_axi4s_0/aclk] [get_bd_pins axi_mem_intercon/M01_ACLK] \
  [get_bd_pins processing_system7_0/S_AXI_HP1_ACLK] [get_bd_pins ps7_0_axi_periph/M01_ACLK] \
  [get_bd_pins fifo_generator_0/wr_clk] [get_bd_pins axi_lite_0/s00_axi_aclk] [get_bd_pins axi_bram_ctrl_0/s_axi_aclk] \
  [get_bd_pins ps7_0_axi_periph/M02_ACLK] [get_bd_pins axi_dma_mm2s/s_axi_lite_aclk] \
  [get_bd_pins axi_dma_mm2s/m_axi_mm2s_aclk] [get_bd_pins gemm_dma_pc/aclk] [get_bd_pins processing_system7_0/S_AXI_HP2_ACLK] \
  [get_bd_pins ps7_0_axi_periph/M03_ACLK] [get_bd_pins ps7_0_axi_periph/M04_ACLK] [get_bd_pins pool_frame_cdc_0/gemm_clk] \
  [get_bd_pins gemm_ctrl_0/s_axi_aclk] [get_bd_pins gemm_top_0/clk]
connect_bd_net [get_bd_pins processing_system7_0/FCLK_RESET0_N] [get_bd_pins rst_ps7_0_200M/ext_reset_in]
connect_bd_net [get_bd_pins rst_ps7_0_200M/peripheral_aresetn] \
  [get_bd_pins axi_vdma_0/axi_resetn] [get_bd_pins ps7_0_axi_periph/M00_ARESETN] [get_bd_pins ps7_0_axi_periph/S00_ARESETN] \
  [get_bd_pins ps7_0_axi_periph/ARESETN] [get_bd_pins axi_mem_intercon/S00_ARESETN] \
  [get_bd_pins axi_mem_intercon/M00_ARESETN] [get_bd_pins axi_mem_intercon/ARESETN] [get_bd_pins v_axi4s_vid_out_0/aresetn] \
  [get_bd_pins axi_mem_intercon/S01_ARESETN] [get_bd_pins axi_mem_intercon/M01_ARESETN] \
  [get_bd_pins ps7_0_axi_periph/M01_ARESETN] [get_bd_pins util_vector_logic_2/Op1] [get_bd_pins axi_lite_0/s00_axi_aresetn] \
  [get_bd_pins v_vid_in_axi4s_0/aresetn] [get_bd_pins axi_bram_ctrl_0/s_axi_aresetn] \
  [get_bd_pins ps7_0_axi_periph/M02_ARESETN] [get_bd_pins axi_dma_mm2s/axi_resetn] [get_bd_pins gemm_dma_pc/aresetn] \
  [get_bd_pins ps7_0_axi_periph/M03_ARESETN] [get_bd_pins ps7_0_axi_periph/M04_ARESETN] \
  [get_bd_pins pool_frame_cdc_0/gemm_rst_n] [get_bd_pins gemm_ctrl_0/s_axi_aresetn] [get_bd_pins gemm_top_0/rst_n]
connect_bd_net [get_bd_pins clk_wiz_0/locked] \
  [get_bd_pins v_tc_0/clken] [get_bd_pins HDMI_top_0/rst_n] [get_bd_pins util_vector_logic_0/Op1] [get_bd_pins v_tc_0/resetn] \
  [get_bd_pins cam_captrue_data_0/rst_n] [get_bd_pins util_vector_logic_1/Op1] [get_bd_pins rom_ctrl_0/pclk_rst] \
  [get_bd_pins ov5640_cfg_top_0/sys_rst_n] [get_bd_pins pix_frame_display_0/sys_rst_n] [get_bd_pins ram_ctrl_lite_0/rst_n] \
  [get_bd_pins cnn_maxpool_2x2_0/rst_n] [get_bd_pins pool_to_ps_ram_ctrl_0/rst_n] [get_bd_pins pool_frame_cdc_0/cam_rst_n] \
  [get_bd_pins vio_to_gray_fixed/rst_n] [get_bd_pins pp_ram_ctrl_0/rst_n] [get_bd_pins cnn_conv_5x5_layer_0/rst_n] \
  [get_bd_pins gray_yo_bin_0/rst_n] [get_bd_pins image_downsample_0/rst_n]
connect_bd_net [get_bd_pins data_gen_0/data_r_o] [get_bd_pins HDMI_top_0/red_data]
connect_bd_net [get_bd_pins data_gen_0/data_g_o] [get_bd_pins HDMI_top_0/green_data]
connect_bd_net [get_bd_pins data_gen_0/data_b_o] [get_bd_pins HDMI_top_0/blue_data]
connect_bd_net [get_bd_pins xlconstant_0/dout] [get_bd_pins v_axi4s_vid_out_0/vid_io_out_ce] [get_bd_pins v_axi4s_vid_out_0/aclken]
connect_bd_net -net sys_rst_n_0_1 [get_bd_ports sys_rst_n_0] [get_bd_pins clk_wiz_0/resetn]
connect_bd_net [get_bd_pins ov5640_cfg_top_0/sccb_clk] [get_bd_ports sccb_clk_0]
connect_bd_net [get_bd_ports sccb_data_0] [get_bd_pins ov5640_cfg_top_0/sccb_data]
connect_bd_net [get_bd_pins cam_captrue_data_0/cam_xclk] [get_bd_ports cam_xclk_0]
connect_bd_net -net cam_vsync_0_1 [get_bd_ports cam_vsync_0] [get_bd_pins cam_captrue_data_0/cam_vsync]
connect_bd_net -net cam_href_0_1 [get_bd_ports cam_href_0] [get_bd_pins cam_captrue_data_0/cam_href]
connect_bd_net -net cam_pclk_0_1 [get_bd_ports cam_pclk_0] [get_bd_pins cam_captrue_data_0/cam_pclk]
connect_bd_net -net cam_data_0_1 [get_bd_ports cam_data_0] [get_bd_pins cam_captrue_data_0/cam_data]
connect_bd_net [get_bd_pins cam_captrue_data_0/vid_clk] \
  [get_bd_pins v_vid_in_axi4s_0/vid_io_in_clk] [get_bd_pins blk_mem_gen_10/clka] [get_bd_pins blk_mem_gen_10/clkb] \
  [get_bd_pins blk_mem_gen_11/clka] [get_bd_pins blk_mem_gen_11/clkb] [get_bd_pins blk_mem_gen_12/clka] \
  [get_bd_pins blk_mem_gen_13/clka] [get_bd_pins blk_mem_gen_14/clka] [get_bd_pins ram_ctrl_lite_0/pclk] \
  [get_bd_pins cnn_maxpool_2x2_0/clk] [get_bd_pins pool_to_ps_ram_ctrl_0/clk] [get_bd_pins pool_frame_cdc_0/cam_clk] \
  [get_bd_pins vio_to_gray_fixed/pclk] [get_bd_pins pp_ram_ctrl_0/clk] [get_bd_pins cnn_conv_5x5_layer_0/clk] \
  [get_bd_pins gray_yo_bin_0/pclk] [get_bd_pins image_downsample_0/pclk]
connect_bd_net [get_bd_pins cam_captrue_data_0/vid_active_video] \
  [get_bd_pins v_vid_in_axi4s_0/vid_active_video] [get_bd_pins vio_to_gray_fixed/vid_active]
connect_bd_net [get_bd_pins cam_captrue_data_0/vid_vsync] [get_bd_pins v_vid_in_axi4s_0/vid_vsync] [get_bd_pins vio_to_gray_fixed/vid_vsync]
connect_bd_net [get_bd_pins cam_captrue_data_0/vid_data] [get_bd_pins v_vid_in_axi4s_0/vid_data] [get_bd_pins vio_to_gray_fixed/vid_data]
connect_bd_net [get_bd_pins clk_wiz_0/clk_50m] [get_bd_pins ov5640_cfg_top_0/sys_clk]
connect_bd_net [get_bd_pins cam_captrue_data_0/vid_ce] [get_bd_pins v_vid_in_axi4s_0/vid_io_in_ce] [get_bd_pins vio_to_gray_fixed/vid_ce]
connect_bd_net [get_bd_pins ov5640_cfg_top_0/sccb_cfg_done] [get_bd_ports sccb_cfg_done_0]
connect_bd_net [get_bd_pins pix_frame_display_0/hdmi_de] [get_bd_pins data_gen_0/de] [get_bd_pins HDMI_top_0/de]
connect_bd_net [get_bd_pins pix_frame_display_0/hdmi_hsync] [get_bd_pins HDMI_top_0/h_sync]
connect_bd_net [get_bd_pins pix_frame_display_0/hdmi_vsync] [get_bd_pins HDMI_top_0/v_sync]
connect_bd_net [get_bd_pins pix_frame_display_0/hdmi_data] [get_bd_pins data_gen_0/data_i]
connect_bd_net [get_bd_pins v_axi4s_vid_out_0/vid_hsync] [get_bd_pins pix_frame_display_0/vio_hsync]
connect_bd_net [get_bd_pins v_axi4s_vid_out_0/vid_vsync] [get_bd_pins pix_frame_display_0/vio_vsync]
connect_bd_net [get_bd_pins v_axi4s_vid_out_0/vid_data] [get_bd_pins pix_frame_display_0/vio_data]
connect_bd_net [get_bd_pins pix_frame_display_0/rom_addr] \
  [get_bd_pins blk_mem_gen_0/addra] [get_bd_pins blk_mem_gen_1/addra] [get_bd_pins blk_mem_gen_2/addra] \
  [get_bd_pins blk_mem_gen_4/addra] [get_bd_pins blk_mem_gen_6/addra] [get_bd_pins blk_mem_gen_9/addra] \
  [get_bd_pins blk_mem_gen_7/addra] [get_bd_pins blk_mem_gen_5/addra] [get_bd_pins blk_mem_gen_8/addra] \
  [get_bd_pins blk_mem_gen_3/addra]
connect_bd_net [get_bd_pins pix_frame_display_0/rom_valid] \
  [get_bd_pins blk_mem_gen_0/ena] [get_bd_pins blk_mem_gen_9/ena] [get_bd_pins blk_mem_gen_1/ena] \
  [get_bd_pins blk_mem_gen_2/ena] [get_bd_pins blk_mem_gen_4/ena] [get_bd_pins blk_mem_gen_6/ena] \
  [get_bd_pins blk_mem_gen_7/ena] [get_bd_pins blk_mem_gen_5/ena] [get_bd_pins blk_mem_gen_8/ena] \
  [get_bd_pins blk_mem_gen_3/ena]
# net axi_lite_0_slv_reg0 has one end: axi_lite_0/slv_reg0
# net axi_lite_0_slv_reg0_fifo_wren has one end: axi_lite_0/slv_reg0_fifo_wren
connect_bd_net [get_bd_pins fifo_generator_0/empty] [get_bd_pins rom_ctrl_0/empty] [get_bd_pins gemm_result_debug_concat/In0]
connect_bd_net [get_bd_pins fifo_generator_0/dout] [get_bd_pins rom_ctrl_0/dout] [get_bd_pins ila_0/probe0]
connect_bd_net [get_bd_pins rom_ctrl_0/rd_en] [get_bd_pins fifo_generator_0/rd_en] [get_bd_pins gemm_result_debug_concat/In1]
connect_bd_net [get_bd_pins util_vector_logic_2/Res] [get_bd_pins fifo_generator_0/wr_rst]
connect_bd_net [get_bd_pins util_vector_logic_1/Res] [get_bd_pins fifo_generator_0/rd_rst]
connect_bd_net [get_bd_pins rom_ctrl_0/rom_data_out] [get_bd_pins pix_frame_display_0/rom_data] [get_bd_pins gemm_result_debug_concat/In2]
connect_bd_net [get_bd_pins blk_mem_gen_5/douta] [get_bd_pins rom_ctrl_0/rom_data5] [get_bd_pins gemm_result_debug_concat/In8]
connect_bd_net [get_bd_pins blk_mem_gen_7/douta] [get_bd_pins rom_ctrl_0/rom_data7] [get_bd_pins gemm_result_debug_concat/In10]
connect_bd_net [get_bd_pins blk_mem_gen_8/douta] [get_bd_pins rom_ctrl_0/rom_data8] [get_bd_pins gemm_result_debug_concat/In11]
connect_bd_net [get_bd_pins blk_mem_gen_9/douta] [get_bd_pins rom_ctrl_0/rom_data9] [get_bd_pins gemm_result_debug_concat/In12]
connect_bd_net [get_bd_pins blk_mem_gen_6/douta] [get_bd_pins rom_ctrl_0/rom_data6] [get_bd_pins gemm_result_debug_concat/In9]
connect_bd_net [get_bd_pins blk_mem_gen_4/douta] [get_bd_pins rom_ctrl_0/rom_data4] [get_bd_pins gemm_result_debug_concat/In7]
connect_bd_net [get_bd_pins blk_mem_gen_3/douta] [get_bd_pins rom_ctrl_0/rom_data3] [get_bd_pins gemm_result_debug_concat/In6]
connect_bd_net [get_bd_pins blk_mem_gen_2/douta] [get_bd_pins rom_ctrl_0/rom_data2] [get_bd_pins gemm_result_debug_concat/In5]
connect_bd_net [get_bd_pins blk_mem_gen_0/douta] [get_bd_pins rom_ctrl_0/rom_data0] [get_bd_pins gemm_result_debug_concat/In3]
connect_bd_net [get_bd_pins blk_mem_gen_1/douta] [get_bd_pins rom_ctrl_0/rom_data1] [get_bd_pins gemm_result_debug_concat/In4]
connect_bd_net [get_bd_pins clk_wiz_0/xclk] [get_bd_pins cam_captrue_data_0/i_xclk]
connect_bd_net -net vio_to_gray_0_gary_data [get_bd_pins vio_to_gray_fixed/gary_data] [get_bd_pins gray_yo_bin_0/gray_data]
connect_bd_net -net vio_to_gray_0_gray_valid [get_bd_pins vio_to_gray_fixed/gray_valid] [get_bd_pins gray_yo_bin_0/gray_valid]
connect_bd_net [get_bd_pins gray_yo_bin_0/bin_data] [get_bd_pins image_downsample_0/bin_data]
connect_bd_net [get_bd_pins gray_yo_bin_0/bin_valid] [get_bd_pins image_downsample_0/bin_valid]
connect_bd_net [get_bd_pins image_downsample_0/pool_valid] [get_bd_pins ram_ctrl_lite_0/pool_valid]
connect_bd_net [get_bd_pins image_downsample_0/pool_data] [get_bd_pins ram_ctrl_lite_0/pool_data]
connect_bd_net [get_bd_pins ram_ctrl_lite_0/cam_we] [get_bd_pins pp_ram_ctrl_0/cam_we]
connect_bd_net [get_bd_pins ram_ctrl_lite_0/cam_addr] [get_bd_pins pp_ram_ctrl_0/cam_addr]
connect_bd_net [get_bd_pins ram_ctrl_lite_0/cam_data] [get_bd_pins pp_ram_ctrl_0/cam_data]
connect_bd_net [get_bd_pins ram_ctrl_lite_0/cam_done] [get_bd_pins pp_ram_ctrl_0/cam_done]
connect_bd_net [get_bd_pins pp_ram_ctrl_0/ramA_we] [get_bd_pins blk_mem_gen_10/wea] [get_bd_pins blk_mem_gen_10/ena]
connect_bd_net [get_bd_pins pp_ram_ctrl_0/ramA_waddr] [get_bd_pins blk_mem_gen_10/addra]
connect_bd_net [get_bd_pins pp_ram_ctrl_0/ramA_wdata] [get_bd_pins blk_mem_gen_10/dina]
connect_bd_net [get_bd_pins pp_ram_ctrl_0/ramA_re] [get_bd_pins blk_mem_gen_10/enb]
connect_bd_net [get_bd_pins pp_ram_ctrl_0/ramA_raddr] [get_bd_pins blk_mem_gen_10/addrb]
connect_bd_net [get_bd_pins blk_mem_gen_10/doutb] [get_bd_pins pp_ram_ctrl_0/ramA_rdata]
connect_bd_net [get_bd_pins pp_ram_ctrl_0/ramB_waddr] [get_bd_pins blk_mem_gen_11/addra]
connect_bd_net [get_bd_pins pp_ram_ctrl_0/ramB_we] [get_bd_pins blk_mem_gen_11/wea] [get_bd_pins blk_mem_gen_11/ena]
connect_bd_net [get_bd_pins pp_ram_ctrl_0/ramB_wdata] [get_bd_pins blk_mem_gen_11/dina]
connect_bd_net [get_bd_pins pp_ram_ctrl_0/ramB_re] [get_bd_pins blk_mem_gen_11/enb]
connect_bd_net [get_bd_pins pp_ram_ctrl_0/ramB_raddr] [get_bd_pins blk_mem_gen_11/addrb]
connect_bd_net [get_bd_pins blk_mem_gen_11/doutb] [get_bd_pins pp_ram_ctrl_0/ramB_rdata]
connect_bd_net [get_bd_pins cnn_maxpool_2x2_0/out_valid] [get_bd_pins pool_to_ps_ram_ctrl_0/pool_valid] [get_bd_pins pool_frame_cdc_0/pool_valid]
connect_bd_net [get_bd_pins cnn_maxpool_2x2_0/out_data] [get_bd_pins pool_to_ps_ram_ctrl_0/pool_data] [get_bd_pins pool_frame_cdc_0/pool_data]
connect_bd_net [get_bd_pins cnn_maxpool_2x2_0/out_ch] [get_bd_pins pool_to_ps_ram_ctrl_0/pool_ch] [get_bd_pins pool_frame_cdc_0/pool_ch]
connect_bd_net [get_bd_pins pool_to_ps_ram_ctrl_0/bram_addr] [get_bd_pins blk_mem_gen_14/addra]
connect_bd_net [get_bd_pins pool_to_ps_ram_ctrl_0/bram_wdata] [get_bd_pins blk_mem_gen_14/dina]
connect_bd_net [get_bd_pins pool_to_ps_ram_ctrl_0/bram_en] [get_bd_pins blk_mem_gen_14/ena]
connect_bd_net [get_bd_pins pool_to_ps_ram_ctrl_0/bram_we] [get_bd_pins blk_mem_gen_14/wea]
connect_bd_net [get_bd_pins pool_to_ps_ram_ctrl_0/ps_intr] [get_bd_pins processing_system7_0/IRQ_F2P]
connect_bd_net [get_bd_pins blk_mem_gen_12/douta] [get_bd_pins cnn_conv_5x5_layer_0/rom_data]
connect_bd_net [get_bd_pins pp_ram_ctrl_0/cnn_start] [get_bd_pins cnn_conv_5x5_layer_0/frame_start]
connect_bd_net [get_bd_pins pp_ram_ctrl_0/cnn_data] [get_bd_pins cnn_conv_5x5_layer_0/ram_data]
connect_bd_net [get_bd_pins cnn_conv_5x5_layer_0/rom_addr] [get_bd_pins blk_mem_gen_12/addra]
connect_bd_net [get_bd_pins cnn_conv_5x5_layer_0/frame_done] [get_bd_pins pp_ram_ctrl_0/cnn_done]
connect_bd_net [get_bd_pins cnn_conv_5x5_layer_0/ram_en] [get_bd_pins pp_ram_ctrl_0/cnn_re]
connect_bd_net [get_bd_pins cnn_conv_5x5_layer_0/ram_addr] [get_bd_pins pp_ram_ctrl_0/cnn_addr]
connect_bd_net [get_bd_pins cnn_conv_5x5_layer_0/out_valid] [get_bd_pins cnn_maxpool_2x2_0/in_valid]
connect_bd_net [get_bd_pins cnn_conv_5x5_layer_0/out_data] [get_bd_pins cnn_maxpool_2x2_0/in_data]
connect_bd_net [get_bd_pins cnn_conv_5x5_layer_0/bias_addr] [get_bd_pins blk_mem_gen_13/addra]
connect_bd_net [get_bd_pins blk_mem_gen_13/douta] [get_bd_pins cnn_conv_5x5_layer_0/bias_data]
connect_bd_net [get_bd_pins cnn_conv_5x5_layer_0/out_ch] [get_bd_pins cnn_maxpool_2x2_0/in_ch]
connect_bd_net [get_bd_pins pool_frame_cdc_0/pool_wr_en] [get_bd_pins gemm_top_0/pool_wr_en]
connect_bd_net [get_bd_pins pool_frame_cdc_0/pool_wr_addr] [get_bd_pins gemm_top_0/pool_wr_addr]
connect_bd_net [get_bd_pins pool_frame_cdc_0/pool_wr_data] [get_bd_pins gemm_top_0/pool_wr_data]
connect_bd_net [get_bd_pins pool_frame_cdc_0/pool_wr_done] [get_bd_pins gemm_ctrl_0/auto_start] [get_bd_pins gemm_top_0/pool_wr_done]
connect_bd_net [get_bd_pins gemm_top_0/pool_wr_ready] [get_bd_pins pool_frame_cdc_0/pool_wr_ready]
connect_bd_net [get_bd_pins gemm_ctrl_0/fc1_weight_base] [get_bd_pins gemm_top_0/fc1_weight_base]
connect_bd_net [get_bd_pins gemm_ctrl_0/fc1_bias_base] [get_bd_pins gemm_top_0/fc1_bias_base]
connect_bd_net [get_bd_pins gemm_ctrl_0/fc2_weight_base] [get_bd_pins gemm_top_0/fc2_weight_base]
connect_bd_net [get_bd_pins gemm_ctrl_0/fc2_bias_base] [get_bd_pins gemm_top_0/fc2_bias_base]
connect_bd_net [get_bd_pins gemm_ctrl_0/fc1_requant_multiplier] [get_bd_pins gemm_top_0/fc1_requant_multiplier]
connect_bd_net [get_bd_pins gemm_ctrl_0/fc1_requant_shift] [get_bd_pins gemm_top_0/fc1_requant_shift]
connect_bd_net [get_bd_pins gemm_ctrl_0/gemm_start] [get_bd_pins gemm_top_0/start]
connect_bd_net [get_bd_pins gemm_ctrl_0/gemm_flush] [get_bd_pins gemm_top_0/flush]
connect_bd_net [get_bd_pins gemm_top_0/busy] [get_bd_pins gemm_ctrl_0/gemm_busy]
connect_bd_net [get_bd_pins gemm_top_0/done] [get_bd_pins gemm_ctrl_0/gemm_done]
connect_bd_net [get_bd_pins gemm_top_0/error] [get_bd_pins gemm_ctrl_0/gemm_error]
connect_bd_net [get_bd_pins gemm_top_0/digit] [get_bd_pins gemm_ctrl_0/gemm_digit] [get_bd_pins gemm_digit_concat/In0]
connect_bd_net [get_bd_pins gemm_top_0/digit_valid] [get_bd_pins gemm_ctrl_0/gemm_digit_valid] [get_bd_pins fifo_generator_0/wr_en]
connect_bd_net [get_bd_pins gemm_top_0/param_section] [get_bd_pins gemm_ctrl_0/param_section]
connect_bd_net [get_bd_pins gemm_digit_zero/dout] [get_bd_pins gemm_digit_concat/In1]
connect_bd_net [get_bd_pins gemm_digit_concat/dout] [get_bd_pins fifo_generator_0/din]
connect_bd_net [get_bd_pins gemm_result_debug_concat/dout] [get_bd_pins ila_0/probe1]
set_property HDL_ATTRIBUTE.BMM_INFO_PROCESSOR {arm > design_1 axi_bram_ctrl_0} [get_bd_cells processing_system7_0]
set_property HDL_ATTRIBUTE.KEEP_HIERARCHY yes [get_bd_cells processing_system7_0]
set_property HDL_ATTRIBUTE.BMM_INFO_ADDRESS_SPACE {byte  0x40000000 32 > design_1 blk_mem_gen_14} [get_bd_cells axi_bram_ctrl_0]
set_property HDL_ATTRIBUTE.KEEP_HIERARCHY yes [get_bd_cells axi_bram_ctrl_0]

# ---- address map ----
assign_bd_address -offset 0x00000000 -range 512M -target_address_space [get_bd_addr_spaces axi_dma_mm2s/Data_MM2S] [get_bd_addr_segs processing_system7_0/S_AXI_HP2/HP2_DDR_LOWOCM]
assign_bd_address -offset 0x00000000 -range 256M -target_address_space [get_bd_addr_spaces axi_vdma_0/Data_MM2S] [get_bd_addr_segs processing_system7_0/S_AXI_HP0/HP0_DDR_LOWOCM]
assign_bd_address -offset 0x10000000 -range 256M -target_address_space [get_bd_addr_spaces axi_vdma_0/Data_MM2S] [get_bd_addr_segs processing_system7_0/S_AXI_HP1/HP1_DDR_LOWOCM]
assign_bd_address -offset 0x00000000 -range 256M -target_address_space [get_bd_addr_spaces axi_vdma_0/Data_S2MM] [get_bd_addr_segs processing_system7_0/S_AXI_HP0/HP0_DDR_LOWOCM]
assign_bd_address -offset 0x10000000 -range 256M -target_address_space [get_bd_addr_spaces axi_vdma_0/Data_S2MM] [get_bd_addr_segs processing_system7_0/S_AXI_HP1/HP1_DDR_LOWOCM]
assign_bd_address -offset 0x40000000 -range 32K -target_address_space [get_bd_addr_spaces processing_system7_0/Data] [get_bd_addr_segs axi_bram_ctrl_0/S_AXI/Mem0]
assign_bd_address -offset 0x43000000 -range 64K -target_address_space [get_bd_addr_spaces processing_system7_0/Data] [get_bd_addr_segs axi_vdma_0/S_AXI_LITE/Reg]
assign_bd_address -offset 0x43010000 -range 64K -target_address_space [get_bd_addr_spaces processing_system7_0/Data] [get_bd_addr_segs axi_dma_mm2s/S_AXI_LITE/Reg]
assign_bd_address -offset 0x43C00000 -range 64K -target_address_space [get_bd_addr_spaces processing_system7_0/Data] [get_bd_addr_segs axi_lite_0/S00_AXI/S00_AXI_reg]
assign_bd_address -offset 0x43C10000 -range 64K -target_address_space [get_bd_addr_spaces processing_system7_0/Data] [get_bd_addr_segs gemm_ctrl_0/s_axi/reg0]

validate_bd_design
save_bd_design
